# Altium schematic sheet LCD-Connector.SchDoc
size A4; SheetNumber: 1; SheetTotal: 1
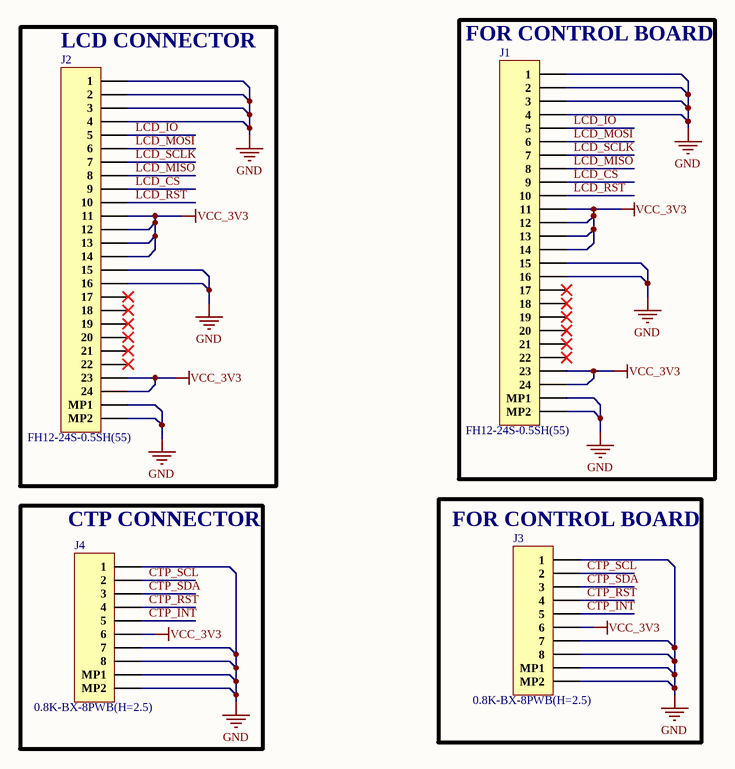
[diagram p0: LCD-Connector.SchDoc]

## Parts
J1  FH12-24S-0.5SH(55)  [FH12-24S-0.5SH(55)]
J2  FH12-24S-0.5SH(55)  [FH12-24S-0.5SH(55)]
J3  0.8K-BX-8PWB(H=2.5)  [0.8K-BX-8PWB(H=2.5)]
J4  0.8K-BX-8PWB(H=2.5)  [0.8K-BX-8PWB(H=2.5)]

## Blocks framed on the sheet
LCD CONNECTOR: J2
FOR CONTROL BOARD: J1
CTP CONNECTOR: J4
FOR CONTROL BOARD: J3

## Nets
GND: J1.1 J1.2 J1.3 J1.4 J1.15 J1.16 J1.MP1 J1.MP2 J2.1 J2.2 J2.3 J2.4 J2.15 J2.16 J2.MP1 J2.MP2 J3.1 J3.7 J3.8 J3.MP1 J3.MP2 J4.1 J4.7 J4.8 J4.MP1 J4.MP2
VCC_3V3: J1.11 J1.12 J1.13 J1.14 J1.23 J1.24 J2.11 J2.12 J2.13 J2.14 J2.23 J2.24 J3.6 J4.6
CTP_INT: J3.5 J4.5
CTP_RST: J3.4 J4.4
CTP_SCL: J3.2 J4.2
CTP_SDA: J3.3 J4.3
LCD_CS: J1.9 J2.9
LCD_IO: J1.5 J2.5
LCD_MISO: J1.8 J2.8
LCD_MOSI: J1.6 J2.6
LCD_RST: J1.10 J2.10
LCD_SCLK: J1.7 J2.7

Not connected (* = marked no-connect by the designer): J1 17* 18* 19* 20* 21* 22*; J2 17* 18* 19* 20* 21* 22*

## Notes on the sheet
- 1
- Huzaifa Ali

## Library data of the parts
J1 J2 = FH12-24S-0.5SH(55): CONN FFC BOTTOM 24POS 0.50MM R/A; Manufacturer: Hirose; Supplier 1: RSComponents; Manufacturer Part Number: FH12-24S-0.5SH(55); RoHS: Yes; Category: FFC / FPC; Stock 1: 30; Pricing 1: 5=0.91700, 100=0.76200, 375=0.63900, 1500=0.59600, 3000=0.55300 (USD); ComponentLink1URL: https://datasheet.ciiva.com/15176/getdatasheetpartid-439675-15176853.pdf?src-supplier=Verical; ComponentLink1Description: https://datasheet.ciiva.com/15176/getdatasheetpartid-439675-15176853.pdf?src-supplier=Verical; ComponentLink2URL: https://datasheet.ciiva.com/22630/58803-22630351.pdf?src-supplier=Farnell; ComponentLink2Description: https://datasheet.ciiva.com/22630/58803-22630351.pdf?src-supplier=Farnell; ComponentLink3URL: https://datasheet.ciiva.com/5137/ed-fh12-20140305-355586-5137161.pdf?src-supplier=Mouser; ComponentLink3Description: https://datasheet.ciiva.com/5137/ed-fh12-20140305-355586-5137161.pdf?src-supplier=Mouser; ComponentLink4URL: https://datasheet.ciiva.com/22697/58803-22697094.pdf?src-supplier=Element14; ComponentLink4Description: https://datasheet.ciiva.com/22697/58803-22697094.pdf?src-supplier=Element14; ComponentLink5URL: https://datasheet.ciiva.com/7661/58803-7661382.pdf?src-supplier=Element14; ComponentLink5Description: https://datasheet.ciiva.com/7661/58803-7661382.pdf?src-supplier=Element14; Supplier Part Number 1: 7388827
J3 J4 = 0.8K-BX-8PWB(H=2.5): Slide Lock -20℃~+85℃ 8 Bottom Contact Surface Mount 0.8mm SMD,P=0.8mm FFC/FPC Connectors ROHS; Manufacturer: HDGC; Manufacturer Part Number: 0.8K-BX-8PWB(H=2.5); Footprint: Custom; ComponentLink1Description: LCSC; ComponentLink1URL: https://lcsc.com/product-detail/FFC-FPC-Connectors_HDGC-0-8K-BX-8PWB-H-2-5_C2915436.html